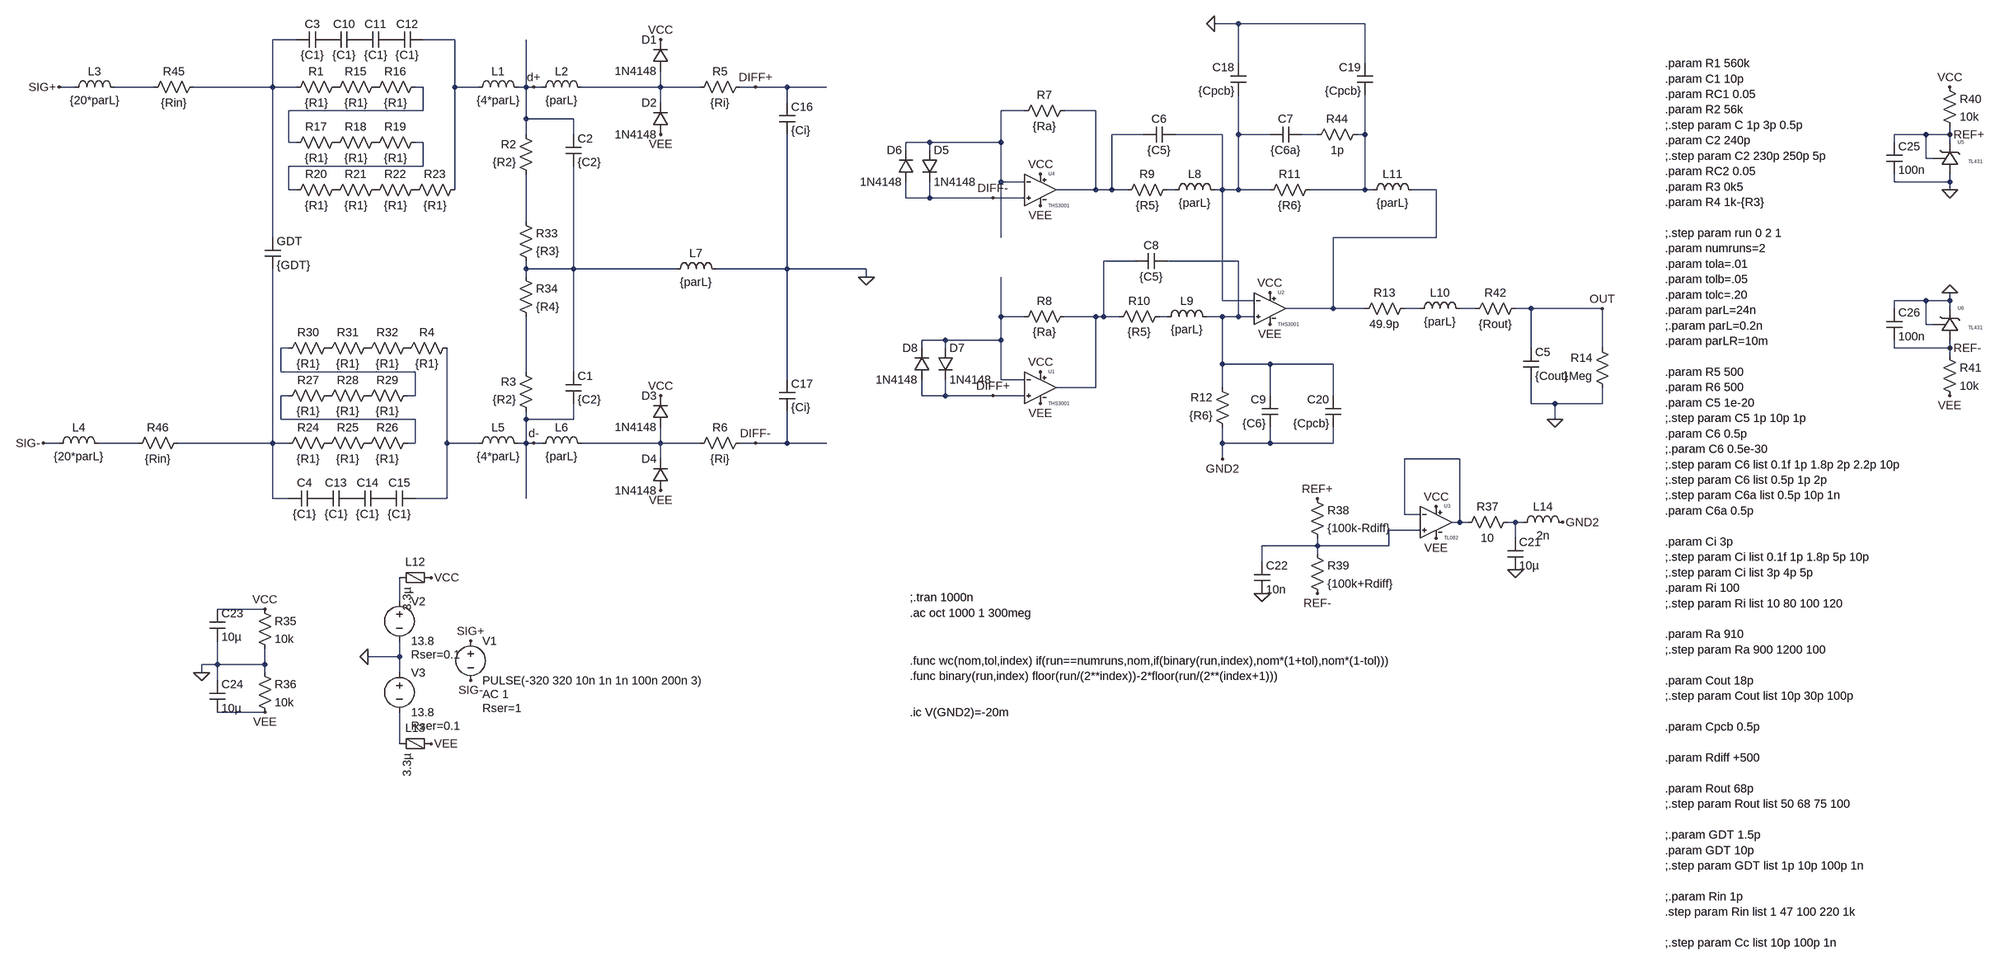
[diagram p0: schematic differential_probe_7_real.asc]
differential_probe_7_real.asc, the LTspice schematic file:
Version 4
SHEET 1 2684 2004
WIRE 992 -176 944 -176
WIRE 1248 -176 992 -176
WIRE -912 -144 -960 -144
WIRE -592 -144 -656 -144
WIRE 992 -96 992 -176
WIRE 1248 -96 1248 -176
WIRE -1360 -48 -1392 -48
WIRE -1200 -48 -1280 -48
WIRE -960 -48 -960 -144
WIRE -960 -48 -1120 -48
WIRE -912 -48 -960 -48
WIRE -656 -48 -672 -48
WIRE -592 -48 -592 -144
WIRE -544 -48 -592 -48
WIRE -448 -48 -448 -144
WIRE -448 -48 -464 -48
WIRE -432 -48 -448 -48
WIRE -416 -48 -432 -48
WIRE -176 -48 -176 -80
WIRE -176 -48 -336 -48
WIRE -96 -48 -176 -48
WIRE 16 -48 -16 -48
WIRE 80 -48 16 -48
WIRE 160 -48 80 -48
WIRE -176 -16 -176 -48
WIRE 80 -16 80 -48
WIRE -656 0 -656 -48
WIRE -656 0 -928 0
WIRE 560 0 512 0
WIRE 704 0 640 0
WIRE -448 16 -448 -48
WIRE -352 16 -448 16
WIRE -448 48 -448 16
WIRE -352 48 -352 16
WIRE 800 48 736 48
WIRE 960 48 864 48
WIRE 992 48 992 -32
WIRE 1056 48 992 48
WIRE 1152 48 1120 48
WIRE 1248 48 1248 -32
WIRE 1248 48 1232 48
WIRE 2464 48 2400 48
WIRE 2512 48 2512 32
WIRE 2512 48 2464 48
WIRE -928 64 -928 0
WIRE -912 64 -928 64
WIRE -656 64 -672 64
WIRE 368 64 320 64
WIRE 512 64 512 0
WIRE 512 64 368 64
WIRE 2400 64 2400 48
WIRE 2512 64 2512 48
WIRE 320 80 320 64
WIRE 368 80 368 64
WIRE 2464 96 2464 48
WIRE 2480 96 2464 96
WIRE -656 112 -656 64
WIRE -656 112 -928 112
WIRE 512 144 512 64
WIRE 560 144 512 144
WIRE 2400 144 2400 128
WIRE 2512 144 2512 128
WIRE 2512 144 2400 144
WIRE -928 160 -928 112
WIRE -912 160 -928 160
WIRE -592 160 -592 -48
WIRE 704 160 704 0
WIRE 704 160 624 160
WIRE 736 160 736 48
WIRE 736 160 704 160
WIRE 768 160 736 160
WIRE 864 160 848 160
WIRE 960 160 960 48
WIRE 960 160 944 160
WIRE 992 160 992 48
WIRE 992 160 960 160
WIRE 1056 160 992 160
WIRE 1248 160 1248 48
WIRE 1248 160 1136 160
WIRE 1264 160 1248 160
WIRE 1392 160 1344 160
WIRE 2512 160 2512 144
WIRE 320 176 320 144
WIRE 368 176 368 144
WIRE 368 176 320 176
WIRE 496 176 368 176
WIRE 560 176 496 176
WIRE -448 224 -448 128
WIRE -960 256 -960 -48
WIRE 512 256 512 144
WIRE 1392 256 1392 160
WIRE 1392 256 1184 256
WIRE 784 304 720 304
WIRE 992 304 848 304
WIRE -448 320 -448 304
WIRE -352 320 -352 112
WIRE -352 320 -448 320
WIRE -144 320 -352 320
WIRE 80 320 80 48
WIRE 80 320 -64 320
WIRE 240 320 80 320
WIRE -448 336 -448 320
WIRE 240 336 240 320
WIRE 960 384 960 160
WIRE 1024 384 960 384
WIRE 2464 384 2400 384
WIRE 2512 384 2512 368
WIRE 2512 384 2464 384
WIRE 1184 400 1184 256
WIRE 1184 400 1088 400
WIRE 1248 400 1184 400
WIRE 1360 400 1328 400
WIRE 1472 400 1440 400
WIRE 1584 400 1552 400
WIRE 1728 400 1584 400
WIRE 2400 400 2400 384
WIRE 2512 400 2512 384
WIRE 512 416 512 336
WIRE 560 416 512 416
WIRE 704 416 640 416
WIRE 720 416 720 304
WIRE 720 416 704 416
WIRE 752 416 720 416
WIRE 848 416 832 416
WIRE 960 416 928 416
WIRE 992 416 992 304
WIRE 992 416 960 416
WIRE 1024 416 992 416
WIRE 2464 432 2464 384
WIRE 2480 432 2464 432
WIRE 400 464 352 464
WIRE 512 464 512 416
WIRE 512 464 400 464
WIRE -928 480 -944 480
WIRE 352 480 352 464
WIRE 400 480 400 464
WIRE 1584 480 1584 400
WIRE 1728 480 1728 400
WIRE 2400 480 2400 464
WIRE 2512 480 2512 464
WIRE 2512 480 2400 480
WIRE 2512 496 2512 480
WIRE 960 512 960 416
WIRE 1056 512 960 512
WIRE 1184 512 1056 512
WIRE -944 528 -944 480
WIRE -672 528 -944 528
WIRE -448 528 -448 416
WIRE -352 528 -352 320
WIRE 80 544 80 320
WIRE 512 544 512 464
WIRE 560 544 512 544
WIRE 704 560 704 416
WIRE 704 560 624 560
WIRE 960 560 960 512
WIRE -928 576 -944 576
WIRE -672 576 -672 528
WIRE -672 576 -688 576
WIRE 352 576 352 544
WIRE 400 576 400 544
WIRE 400 576 352 576
WIRE 496 576 400 576
WIRE 560 576 496 576
WIRE 1056 576 1056 512
WIRE 1184 576 1184 512
WIRE 1584 592 1584 544
WIRE 1632 592 1584 592
WIRE 1728 592 1728 560
WIRE 1728 592 1632 592
WIRE -944 624 -944 576
WIRE -672 624 -944 624
WIRE -448 624 -448 608
WIRE -352 624 -352 592
WIRE -352 624 -448 624
WIRE 1632 624 1632 592
WIRE -1392 672 -1424 672
WIRE -1232 672 -1312 672
WIRE -960 672 -960 320
WIRE -960 672 -1152 672
WIRE -928 672 -960 672
WIRE -672 672 -672 624
WIRE -672 672 -688 672
WIRE -608 672 -608 480
WIRE -544 672 -608 672
WIRE -448 672 -448 624
WIRE -448 672 -464 672
WIRE -432 672 -448 672
WIRE -416 672 -432 672
WIRE -176 672 -176 640
WIRE -176 672 -336 672
WIRE -96 672 -176 672
WIRE 16 672 -16 672
WIRE 80 672 80 608
WIRE 80 672 16 672
WIRE 160 672 80 672
WIRE 960 672 960 640
WIRE 1056 672 1056 640
WIRE 1056 672 960 672
WIRE 1184 672 1184 640
WIRE 1184 672 1056 672
WIRE -176 704 -176 672
WIRE 960 704 960 672
WIRE 1440 704 1328 704
WIRE -960 784 -960 672
WIRE -928 784 -960 784
WIRE -608 784 -608 672
WIRE -608 784 -672 784
WIRE -448 784 -448 672
WIRE 1328 816 1328 704
WIRE 1360 816 1328 816
WIRE 1440 832 1440 704
WIRE 1440 832 1424 832
WIRE 1456 832 1440 832
WIRE 1552 832 1536 832
WIRE 1568 832 1552 832
WIRE 1360 848 1296 848
WIRE 1552 864 1552 832
WIRE 1152 880 1152 864
WIRE 1152 880 1040 880
WIRE 1296 880 1296 848
WIRE 1296 880 1152 880
WIRE 1152 896 1152 880
WIRE 1040 912 1040 880
WIRE -704 992 -704 944
WIRE -976 1008 -1072 1008
WIRE -704 1104 -704 1072
WIRE -704 1104 -768 1104
WIRE -1072 1120 -1072 1072
WIRE -1072 1120 -1104 1120
WIRE -976 1120 -976 1088
WIRE -976 1120 -1072 1120
WIRE -1104 1136 -1104 1120
WIRE -976 1136 -976 1120
WIRE -704 1136 -704 1104
WIRE -1072 1152 -1072 1120
WIRE -976 1216 -1072 1216
WIRE -704 1280 -704 1216
FLAG 240 336 0
FLAG -1392 -48 SIG+
FLAG -1424 672 SIG-
FLAG 16 -48 DIFF+
FLAG 16 672 DIFF-
FLAG -560 1072 SIG+
FLAG -560 1152 SIG-
FLAG -1104 1136 0
FLAG -640 944 VCC
FLAG -640 1280 VEE
FLAG 592 128 VCC
FLAG 592 528 VCC
FLAG 592 192 VEE
FLAG 592 592 VEE
FLAG 1056 432 VEE
FLAG 1056 368 VCC
FLAG 1632 624 0
FLAG 1728 400 OUT
FLAG -176 48 VEE
FLAG -176 -144 VCC
FLAG -176 768 VEE
FLAG -176 576 VCC
FLAG 496 576 DIFF+
FLAG 496 176 DIFF-
FLAG -432 -48 d+
FLAG -432 672 d-
FLAG -976 1008 VCC
FLAG -976 1216 VEE
FLAG 1392 800 VCC
FLAG 1392 864 VEE
FLAG 1648 832 GND2
FLAG 960 704 GND2
FLAG 944 -176 0
FLAG 1552 928 0
FLAG 2512 -48 VCC
FLAG 2512 576 VEE
FLAG 2512 368 0
FLAG 2512 160 0
FLAG 2512 48 REF+
FLAG 2512 480 REF-
FLAG 1152 976 REF-
FLAG 1152 784 REF+
FLAG -768 1104 0
FLAG 1040 976 0
SYMBOL res -816 -64 R90
WINDOW 0 0 56 VBottom 2
WINDOW 3 32 56 VTop 2
SYMATTR InstName R1
SYMATTR Value {R1}
SYMBOL res -432 144 R180
WINDOW 0 36 76 Left 2
WINDOW 3 36 40 Left 2
SYMATTR InstName R2
SYMATTR Value {R2}
SYMBOL res -432 624 R180
WINDOW 0 36 76 Left 2
WINDOW 3 36 40 Left 2
SYMATTR InstName R3
SYMATTR Value {R2}
SYMBOL cap -368 528 R0
SYMATTR InstName C1
SYMATTR Value {C2}
SYMATTR SpiceLine Rser={RC2}
SYMBOL cap -368 48 R0
SYMATTR InstName C2
SYMATTR Value {C2}
SYMATTR SpiceLine Rser={RC2}
SYMBOL cap -848 -160 R90
WINDOW 0 0 32 VBottom 2
WINDOW 3 32 32 VTop 2
SYMATTR InstName C3
SYMATTR Value {C1}
SYMATTR SpiceLine Rser={RC1}
SYMBOL res 0 -64 R90
WINDOW 0 0 56 VBottom 2
WINDOW 3 32 56 VTop 2
SYMATTR InstName R5
SYMATTR Value {Ri}
SYMBOL res 0 656 R90
WINDOW 0 0 56 VBottom 2
WINDOW 3 32 56 VTop 2
SYMATTR InstName R6
SYMATTR Value {Ri}
SYMBOL voltage -560 1056 R0
WINDOW 123 24 124 Left 2
WINDOW 39 24 152 Left 2
SYMATTR Value2 AC 1
SYMATTR SpiceLine Rser=1
SYMATTR InstName V1
SYMATTR Value PULSE(-320 320 10n 1n 1n 100n 200n 3)
SYMBOL voltage -704 976 R0
WINDOW 123 0 0 Left 0
WINDOW 39 24 124 Left 2
SYMATTR SpiceLine Rser=0.1
SYMATTR InstName V2
SYMATTR Value 13.8
SYMBOL voltage -704 1120 R0
WINDOW 123 0 0 Left 0
WINDOW 39 24 124 Left 2
SYMATTR SpiceLine Rser=0.1
SYMATTR InstName V3
SYMATTR Value 13.8
SYMBOL res 656 -16 R90
WINDOW 0 0 56 VBottom 2
WINDOW 3 32 56 VTop 2
SYMATTR InstName R7
SYMATTR Value {Ra}
SYMBOL res 656 400 R90
WINDOW 0 0 56 VBottom 2
WINDOW 3 32 56 VTop 2
SYMATTR InstName R8
SYMATTR Value {Ra}
SYMBOL res 864 144 R90
WINDOW 0 0 56 VBottom 2
WINDOW 3 32 56 VTop 2
SYMATTR InstName R9
SYMATTR Value {R5}
SYMBOL res 848 400 R90
WINDOW 0 0 56 VBottom 2
WINDOW 3 32 56 VTop 2
SYMATTR InstName R10
SYMATTR Value {R5}
SYMBOL res 1152 144 R90
WINDOW 0 0 56 VBottom 2
WINDOW 3 32 56 VTop 2
SYMATTR InstName R11
SYMATTR Value {R6}
SYMBOL res 976 656 R180
WINDOW 0 36 76 Left 2
WINDOW 3 36 40 Left 2
SYMATTR InstName R12
SYMATTR Value {R6}
SYMBOL res 1344 384 R90
WINDOW 0 0 56 VBottom 2
WINDOW 3 32 56 VTop 2
SYMATTR InstName R13
SYMATTR Value 49.9p
SYMBOL res 1744 576 R180
WINDOW 0 36 76 Left 2
WINDOW 3 36 40 Left 2
SYMATTR InstName R14
SYMATTR Value 1Meg
SYMBOL cap 1568 480 R0
SYMATTR InstName C5
SYMATTR Value {Cout}
SYMBOL diode -160 -80 R180
WINDOW 0 24 64 Left 2
WINDOW 3 24 0 Left 2
SYMATTR InstName D1
SYMATTR Value 1N4148
SYMBOL diode -160 48 R180
WINDOW 0 24 64 Left 2
WINDOW 3 24 0 Left 2
SYMATTR InstName D2
SYMATTR Value 1N4148
SYMBOL diode -160 640 R180
WINDOW 0 24 64 Left 2
WINDOW 3 24 0 Left 2
SYMATTR InstName D3
SYMATTR Value 1N4148
SYMBOL diode -160 768 R180
WINDOW 0 24 64 Left 2
WINDOW 3 24 0 Left 2
SYMATTR InstName D4
SYMATTR Value 1N4148
SYMBOL ind -560 -32 R270
WINDOW 0 32 56 VTop 2
WINDOW 3 5 56 VBottom 2
SYMATTR InstName L1
SYMATTR Value {4*parL}
SYMBOL ind -432 -32 R270
WINDOW 0 32 56 VTop 2
WINDOW 3 5 56 VBottom 2
SYMATTR InstName L2
SYMATTR Value {parL}
SYMBOL ind -1376 -32 R270
WINDOW 0 32 56 VTop 2
WINDOW 3 5 56 VBottom 2
SYMATTR InstName L3
SYMATTR Value {20*parL}
SYMBOL ind -1408 688 R270
WINDOW 0 32 56 VTop 2
WINDOW 3 5 56 VBottom 2
SYMATTR InstName L4
SYMATTR Value {20*parL}
SYMBOL ind -560 688 R270
WINDOW 0 32 56 VTop 2
WINDOW 3 5 56 VBottom 2
SYMATTR InstName L5
SYMATTR Value {4*parL}
SYMBOL ind -432 688 R270
WINDOW 0 32 56 VTop 2
WINDOW 3 5 56 VBottom 2
SYMATTR InstName L6
SYMATTR Value {parL}
SYMBOL ind -160 336 R270
WINDOW 0 32 56 VTop 2
WINDOW 3 5 56 VBottom 2
SYMATTR InstName L7
SYMATTR Value {parL}
SYMATTR SpiceLine Rser={parLR}
SYMBOL ind 848 176 R270
WINDOW 0 32 56 VTop 2
WINDOW 3 5 56 VBottom 2
SYMATTR InstName L8
SYMATTR Value {parL}
SYMATTR SpiceLine Rser={parLR}
SYMBOL ind 832 432 R270
WINDOW 0 32 56 VTop 2
WINDOW 3 5 56 VBottom 2
SYMATTR InstName L9
SYMATTR Value {parL}
SYMATTR SpiceLine Rser={parLR}
SYMBOL ind 1344 416 R270
WINDOW 0 32 56 VTop 2
WINDOW 3 5 56 VBottom 2
SYMATTR InstName L10
SYMATTR Value {parL}
SYMATTR SpiceLine Rser={parLR}
SYMBOL ind 1248 176 R270
WINDOW 0 32 56 VTop 2
WINDOW 3 5 56 VBottom 2
SYMATTR InstName L11
SYMATTR Value {parL}
SYMATTR SpiceLine Rser={parLR}
SYMBOL cap 864 32 R90
WINDOW 0 0 32 VBottom 2
WINDOW 3 32 32 VTop 2
SYMATTR InstName C6
SYMATTR Value {C5}
SYMBOL cap 1120 32 R90
WINDOW 0 0 32 VBottom 2
WINDOW 3 32 32 VTop 2
SYMATTR InstName C7
SYMATTR Value {C6a}
SYMATTR SpiceLine Rser=0.01
SYMBOL cap 848 288 R90
WINDOW 0 0 32 VBottom 2
WINDOW 3 32 32 VTop 2
SYMATTR InstName C8
SYMATTR Value {C5}
SYMBOL cap 1072 640 R180
WINDOW 0 24 56 Left 2
WINDOW 3 24 8 Left 2
SYMATTR InstName C9
SYMATTR Value {C6}
SYMATTR SpiceLine Rser=0.01
SYMBOL res -736 -64 R90
WINDOW 0 0 56 VBottom 2
WINDOW 3 32 56 VTop 2
SYMATTR InstName R15
SYMATTR Value {R1}
SYMBOL res -656 -64 R90
WINDOW 0 0 56 VBottom 2
WINDOW 3 32 56 VTop 2
SYMATTR InstName R16
SYMATTR Value {R1}
SYMBOL res -816 48 R90
WINDOW 0 0 56 VBottom 2
WINDOW 3 32 56 VTop 2
SYMATTR InstName R17
SYMATTR Value {R1}
SYMBOL res -736 48 R90
WINDOW 0 0 56 VBottom 2
WINDOW 3 32 56 VTop 2
SYMATTR InstName R18
SYMATTR Value {R1}
SYMBOL res -656 48 R90
WINDOW 0 0 56 VBottom 2
WINDOW 3 32 56 VTop 2
SYMATTR InstName R19
SYMATTR Value {R1}
SYMBOL res -816 144 R90
WINDOW 0 0 56 VBottom 2
WINDOW 3 32 56 VTop 2
SYMATTR InstName R20
SYMATTR Value {R1}
SYMBOL res -736 144 R90
WINDOW 0 0 56 VBottom 2
WINDOW 3 32 56 VTop 2
SYMATTR InstName R21
SYMATTR Value {R1}
SYMBOL res -656 144 R90
WINDOW 0 0 56 VBottom 2
WINDOW 3 32 56 VTop 2
SYMATTR InstName R22
SYMATTR Value {R1}
SYMBOL res -576 144 R90
WINDOW 0 0 56 VBottom 2
WINDOW 3 32 56 VTop 2
SYMATTR InstName R23
SYMATTR Value {R1}
SYMBOL cap -784 -160 R90
WINDOW 0 0 32 VBottom 2
WINDOW 3 32 32 VTop 2
SYMATTR InstName C10
SYMATTR Value {C1}
SYMATTR SpiceLine Rser={RC1}
SYMBOL cap -720 -160 R90
WINDOW 0 0 32 VBottom 2
WINDOW 3 32 32 VTop 2
SYMATTR InstName C11
SYMATTR Value {C1}
SYMATTR SpiceLine Rser={RC1}
SYMBOL cap -656 -160 R90
WINDOW 0 0 32 VBottom 2
WINDOW 3 32 32 VTop 2
SYMATTR InstName C12
SYMATTR Value {C1}
SYMATTR SpiceLine Rser={RC1}
SYMBOL res -832 656 R90
WINDOW 0 0 56 VBottom 2
WINDOW 3 32 56 VTop 2
SYMATTR InstName R24
SYMATTR Value {R1}
SYMBOL res -752 656 R90
WINDOW 0 0 56 VBottom 2
WINDOW 3 32 56 VTop 2
SYMATTR InstName R25
SYMATTR Value {R1}
SYMBOL res -672 656 R90
WINDOW 0 0 56 VBottom 2
WINDOW 3 32 56 VTop 2
SYMATTR InstName R26
SYMATTR Value {R1}
SYMBOL res -832 560 R90
WINDOW 0 0 56 VBottom 2
WINDOW 3 32 56 VTop 2
SYMATTR InstName R27
SYMATTR Value {R1}
SYMBOL res -752 560 R90
WINDOW 0 0 56 VBottom 2
WINDOW 3 32 56 VTop 2
SYMATTR InstName R28
SYMATTR Value {R1}
SYMBOL res -672 560 R90
WINDOW 0 0 56 VBottom 2
WINDOW 3 32 56 VTop 2
SYMATTR InstName R29
SYMATTR Value {R1}
SYMBOL res -832 464 R90
WINDOW 0 0 56 VBottom 2
WINDOW 3 32 56 VTop 2
SYMATTR InstName R30
SYMATTR Value {R1}
SYMBOL res -752 464 R90
WINDOW 0 0 56 VBottom 2
WINDOW 3 32 56 VTop 2
SYMATTR InstName R31
SYMATTR Value {R1}
SYMBOL res -672 464 R90
WINDOW 0 0 56 VBottom 2
WINDOW 3 32 56 VTop 2
SYMATTR InstName R32
SYMATTR Value {R1}
SYMBOL res -592 464 R90
WINDOW 0 0 56 VBottom 2
WINDOW 3 32 56 VTop 2
SYMATTR InstName R4
SYMATTR Value {R1}
SYMBOL cap -864 768 R90
WINDOW 0 0 32 VBottom 2
WINDOW 3 32 32 VTop 2
SYMATTR InstName C4
SYMATTR Value {C1}
SYMATTR SpiceLine Rser={RC1}
SYMBOL cap -800 768 R90
WINDOW 0 0 32 VBottom 2
WINDOW 3 32 32 VTop 2
SYMATTR InstName C13
SYMATTR Value {C1}
SYMATTR SpiceLine Rser={RC1}
SYMBOL cap -736 768 R90
WINDOW 0 0 32 VBottom 2
WINDOW 3 32 32 VTop 2
SYMATTR InstName C14
SYMATTR Value {C1}
SYMATTR SpiceLine Rser={RC1}
SYMBOL cap -672 768 R90
WINDOW 0 0 32 VBottom 2
WINDOW 3 32 32 VTop 2
SYMATTR InstName C15
SYMATTR Value {C1}
SYMATTR SpiceLine Rser={RC1}
SYMBOL res -464 208 R0
SYMATTR InstName R33
SYMATTR Value {R3}
SYMBOL res -464 320 R0
SYMATTR InstName R34
SYMATTR Value {R4}
SYMBOL THS3001 592 96 R0
SYMATTR InstName U4
SYMBOL THS3001 592 496 R0
SYMATTR InstName U1
SYMBOL THS3001 1056 336 R0
SYMATTR InstName U2
SYMBOL cap 64 -16 R0
SYMATTR InstName C16
SYMATTR Value {Ci}
SYMBOL cap 64 544 R0
SYMATTR InstName C17
SYMATTR Value {Ci}
SYMBOL cap -976 256 R0
SYMATTR InstName GDT
SYMATTR Value {GDT}
SYMBOL res -992 992 R0
SYMATTR InstName R35
SYMATTR Value 10k
SYMBOL res -992 1120 R0
SYMATTR InstName R36
SYMATTR Value 10k
SYMBOL cap 1008 -32 R180
WINDOW 0 24 56 Left 2
WINDOW 3 24 8 Left 2
SYMATTR InstName C18
SYMATTR Value {Cpcb}
SYMATTR SpiceLine Rser=0.01
SYMBOL cap 1264 -32 R180
WINDOW 0 24 56 Left 2
WINDOW 3 24 8 Left 2
SYMATTR InstName C19
SYMATTR Value {Cpcb}
SYMATTR SpiceLine Rser=0.01
SYMBOL cap 1200 640 R180
WINDOW 0 24 56 Left 2
WINDOW 3 24 8 Left 2
SYMATTR InstName C20
SYMATTR Value {Cpcb}
SYMATTR SpiceLine Rser=0.01
SYMBOL FerriteBead -672 944 R90
WINDOW 0 -16 0 VBottom 2
SYMATTR InstName L12
SYMATTR Value 3.3µ
SYMATTR SpiceLine Ipk=0.6 Rser=0.23 Rpar=1050 Cpar=680f mfg="Würth Elektronik" pn="742792662 WE-CBF 0603"
SYMBOL FerriteBead -672 1280 R90
WINDOW 0 -16 0 VBottom 2
SYMATTR InstName L13
SYMATTR Value 3.3µ
SYMATTR SpiceLine Ipk=0.6 Rser=0.23 Rpar=1050 Cpar=680f mfg="Würth Elektronik" pn="742792662 WE-CBF 0603"
SYMBOL cap 1536 864 R0
SYMATTR InstName C21
SYMATTR Value 10µ
SYMBOL res 1552 816 R90
WINDOW 0 0 56 VBottom 2
WINDOW 3 32 56 VTop 2
SYMATTR InstName R37
SYMATTR Value 10
SYMBOL res 1136 768 R0
SYMATTR InstName R38
SYMATTR Value {100k-Rdiff}
SYMBOL res 1136 880 R0
SYMATTR InstName R39
SYMATTR Value {100k+Rdiff}
SYMBOL cap -1088 1008 R0
SYMATTR InstName C23
SYMATTR Value 10µ
SYMATTR SpiceLine V=25 Irms=0 Rser=0 Lser=0 mfg="Murata" pn="GRM188R61E106MA73" type="X5R"
SYMBOL cap -1088 1152 R0
SYMATTR InstName C24
SYMATTR Value 10µ
SYMATTR SpiceLine V=25 Irms=0 Rser=0 Lser=0 mfg="Murata" pn="GRM188R61E106MA73" type="X5R"
SYMBOL res 2496 -64 R0
SYMATTR InstName R40
SYMATTR Value 10k
SYMBOL cap 2384 64 R0
SYMATTR InstName C25
SYMATTR Value 100n
SYMBOL res 2496 480 R0
SYMATTR InstName R41
SYMATTR Value 10k
SYMBOL cap 2384 400 R0
SYMATTR InstName C26
SYMATTR Value 100n
SYMBOL TL082 1392 768 R0
SYMATTR InstName U3
SYMBOL TL431 2496 64 R0
SYMATTR InstName U5
SYMBOL TL431 2496 400 R0
SYMATTR InstName U6
SYMBOL diode 352 80 R0
SYMATTR InstName D5
SYMATTR Value 1N4148
SYMBOL diode 336 144 R180
WINDOW 0 24 64 Left 2
WINDOW 3 24 0 Left 2
SYMATTR InstName D6
SYMATTR Value 1N4148
SYMBOL diode 384 480 R0
SYMATTR InstName D7
SYMATTR Value 1N4148
SYMBOL diode 368 544 R180
WINDOW 0 24 64 Left 2
WINDOW 3 24 0 Left 2
SYMATTR InstName D8
SYMATTR Value 1N4148
SYMBOL res 1568 384 R90
WINDOW 0 0 56 VBottom 2
WINDOW 3 32 56 VTop 2
SYMATTR InstName R42
SYMATTR Value {Rout}
SYMBOL cap 1024 912 R0
SYMATTR InstName C22
SYMATTR Value 10n
SYMBOL ind 1552 848 R270
WINDOW 0 32 56 VTop 2
WINDOW 3 5 56 VBottom 2
SYMATTR InstName L14
SYMATTR Value 2n
SYMBOL res 1248 32 R90
WINDOW 0 0 56 VBottom 2
WINDOW 3 32 56 VTop 2
SYMATTR InstName R44
SYMATTR Value 1p
SYMBOL res -1104 -64 R90
WINDOW 0 0 56 VBottom 2
WINDOW 3 32 56 VTop 2
SYMATTR InstName R45
SYMATTR Value {Rin}
SYMBOL res -1136 656 R90
WINDOW 0 0 56 VBottom 2
WINDOW 3 32 56 VTop 2
SYMATTR InstName R46
SYMATTR Value {Rin}
TEXT 328 984 Left 2 !;.tran 1000n\n.ac oct 1000 1 300meg
TEXT 328 1112 Left 2 !.func wc(nom,tol,index) if(run==numruns,nom,if(binary(run,index),nom*(1+tol),nom*(1-tol)))\n.func binary(run,index) floor(run/(2**index))-2*floor(run/(2**(index+1)))
TEXT 1936 -96 Left 2 !.param R1 560k\n.param C1 10p\n.param RC1 0.05\n.param R2 56k\n;.step param C 1p 3p 0.5p\n.param C2 240p\n;.step param C2 230p 250p 5p\n.param RC2 0.05\n.param R3 0k5\n.param R4 1k-{R3}\n \n;.step param run 0 2 1\n.param numruns=2\n.param tola=.01\n.param tolb=.05\n.param tolc=.20\n.param parL=24n\n;.param parL=0.2n\n.param parLR=10m\n \n.param R5 500\n.param R6 500\n.param C5 1e-20\n;.step param C5 1p 10p 1p\n.param C6 0.5p\n;.param C6 0.5e-30\n;.step param C6 list 0.1f 1p 1.8p 2p 2.2p 10p\n;.step param C6 list 0.5p 1p 2p\n;.step param C6a list 0.5p 10p 1n\n.param C6a 0.5p\n \n.param Ci 3p \n;.step param Ci list 0.1f 1p 1.8p 5p 10p\n;.step param Ci list 3p 4p 5p\n.param Ri 100\n;.step param Ri list 10 80 100 120\n \n.param Ra 910\n;.step param Ra 900 1200 100\n \n.param Cout 18p\n;.step param Cout list 10p 30p 100p\n \n.param Cpcb 0.5p\n \n.param Rdiff +500\n \n.param Rout 68p\n;.step param Rout list 50 68 75 100\n \n;.param GDT 1.5p\n.param GDT 10p\n;.step param GDT list 1p 10p 100p 1n\n \n;.param Rin 1p\n.step param Rin list 1 47 100 220 1k\n \n;.step param Cc list 10p 100p 1n
TEXT 328 1216 Left 2 !.ic V(GND2)=-20m

The netlist it stands for:
* differential_probe_7_real.asc
R1 P001 N001 {R1}
R2 N014 d+ {R2}
R3 d- N023 {R2}
C1 N017 d- {C2} Rser={RC2}
C2 d+ N017 {C2} Rser={RC2}
C3 P002 N001 {C1} Rser={RC1}
R5 DIFF+ N005 {Ri}
R6 DIFF- N028 {Ri}
V1 SIG+ SIG- PULSE(-320 320 10n 1n 1n 100n 200n 3) AC 1 Rser=1
V2 N032 0 13.8 Rser=0.1
V3 0 N033 13.8 Rser=0.1
R7 N007 N006 {Ra}
R8 N015 N020 {Ra}
R9 N012 N007 {R5}
R10 N021 N015 {R5}
R11 N010 N008 {R6}
R12 GND2 N016 {R6}
R13 N018 N013 49.9p
R14 0 OUT 1Meg
C5 OUT 0 {Cout}
D1 N005 VCC 1N4148
D2 VEE N005 1N4148
D3 N028 VCC 1N4148
D4 VEE N028 1N4148
L1 N002 d+ {4*parL}
L2 d+ N005 {parL}
L3 SIG+ N003 {20*parL}
L4 SIG- N025 {20*parL}
L5 N027 d- {4*parL}
L6 d- N028 {parL}
L7 N017 0 {parL} Rser={parLR}
L8 N012 N008 {parL} Rser={parLR}
L9 N021 N016 {parL} Rser={parLR}
L10 N018 N019 {parL} Rser={parLR}
L11 N010 N013 {parL} Rser={parLR}
C6 N008 N007 {C5}
C7 N009 N008 {C6a} Rser=0.01
C8 N016 N015 {C5}
C9 GND2 N016 {C6} Rser=0.01
R15 P003 P001 {R1}
R16 N004 P003 {R1}
R17 P004 N004 {R1}
R18 P005 P004 {R1}
R19 N011 P005 {R1}
R20 P006 N011 {R1}
R21 P007 P006 {R1}
R22 P008 P007 {R1}
R23 N002 P008 {R1}
C10 P009 P002 {C1} Rser={RC1}
C11 P010 P009 {C1} Rser={RC1}
C12 N002 P010 {C1} Rser={RC1}
R24 P011 N026 {R1}
R25 P012 P011 {R1}
R26 N024 P012 {R1}
R27 P013 N024 {R1}
R28 P014 P013 {R1}
R29 N022 P014 {R1}
R30 P015 N022 {R1}
R31 P016 P015 {R1}
R32 P017 P016 {R1}
R4 N027 P017 {R1}
C4 P018 N026 {C1} Rser={RC1}
C13 P019 P018 {C1} Rser={RC1}
C14 P020 P019 {C1} Rser={RC1}
C15 N027 P020 {C1} Rser={RC1}
R33 N014 N017 {R3}
R34 N017 N023 {R4}
XU4 DIFF- N006 VCC VEE N007 THS3001  ; pins IN+ IN- VCC VEE OUT
XU1 DIFF+ N020 VCC VEE N015 THS3001  ; pins IN+ IN- VCC VEE OUT
XU2 N016 N008 VCC VEE N013 THS3001  ; pins IN+ IN- VCC VEE OUT
C16 DIFF+ 0 {Ci}
C17 0 DIFF- {Ci}
C§GDT N001 N026 {GDT}
R35 VCC 0 10k
R36 0 VEE 10k
C18 N008 0 {Cpcb} Rser=0.01
C19 N010 0 {Cpcb} Rser=0.01
C20 GND2 N016 {Cpcb} Rser=0.01
L12 VCC N032 3.3µ Ipk=0.6 Rser=0.23 Rpar=1050 Cpar=680f mfg="Würth Elektronik" pn="742792662 WE-CBF 0603"
L13 VEE N033 3.3µ Ipk=0.6 Rser=0.23 Rpar=1050 Cpar=680f mfg="Würth Elektronik" pn="742792662 WE-CBF 0603"
C21 N030 0 10µ
R37 N030 N029 10
R38 REF+ N031 {100k-Rdiff}
R39 N031 REF- {100k+Rdiff}
C23 VCC 0 10µ V=25 Irms=0 Rser=0 Lser=0 mfg="Murata" pn="GRM188R61E106MA73" type="X5R"
C24 0 VEE 10µ V=25 Irms=0 Rser=0 Lser=0 mfg="Murata" pn="GRM188R61E106MA73" type="X5R"
R40 VCC REF+ 10k
C25 REF+ 0 100n
R41 REF- VEE 10k
C26 0 REF- 100n
XU3 N031 N029 VCC VEE N029 TL082  ; pins IN+ IN- VCC VEE OUT
XU5 0 REF+ REF+ TL431  ; pins A K R
XU6 REF- 0 0 TL431  ; pins A K R
D5 N006 DIFF- 1N4148
D6 DIFF- N006 1N4148
D7 N020 DIFF+ 1N4148
D8 DIFF+ N020 1N4148
R42 OUT N019 {Rout}
C22 N031 0 10n
L14 N030 GND2 2n
R44 N010 N009 1p
R45 N001 N003 {Rin}
R46 N026 N025 {Rin}
.model D D
.lib standard.dio
;.tran 1000n
.ac oct 1000 1 300meg
.func wc(nom,tol,index) if(run==numruns,nom,if(binary(run,index),nom*(1+tol),nom*(1-tol)))
.func binary(run,index) floor(run/(2**index))-2*floor(run/(2**(index+1)))
.param R1 560k
.param C1 10p
.param RC1 0.05
.param R2 56k
;.step param C 1p 3p 0.5p
.param C2 240p
;.step param C2 230p 250p 5p
.param RC2 0.05
.param R3 0k5
.param R4 1k-{R3}
;.step param run 0 2 1
.param numruns=2
.param tola=.01
.param tolb=.05
.param tolc=.20
.param parL=24n
;.param parL=0.2n
.param parLR=10m
.param R5 500
.param R6 500
.param C5 1e-20
;.step param C5 1p 10p 1p
.param C6 0.5p
;.param C6 0.5e-30
;.step param C6 list 0.1f 1p 1.8p 2p 2.2p 10p
;.step param C6 list 0.5p 1p 2p
;.step param C6a list 0.5p 10p 1n
.param C6a 0.5p
.param Ci 3p
;.step param Ci list 0.1f 1p 1.8p 5p 10p
;.step param Ci list 3p 4p 5p
.param Ri 100
;.step param Ri list 10 80 100 120
.param Ra 910
;.step param Ra 900 1200 100
.param Cout 18p
;.step param Cout list 10p 30p 100p
.param Cpcb 0.5p
.param Rdiff +500
.param Rout 68p
;.step param Rout list 50 68 75 100
;.param GDT 1.5p
.param GDT 10p
;.step param GDT list 1p 10p 100p 1n
;.param Rin 1p
.step param Rin list 1 47 100 220 1k
;.step param Cc list 10p 100p 1n
.ic V(GND2)=-20m
.lib THS3001.lib
.lib TL082.sub
.lib TL431.lib
.backanno
.end